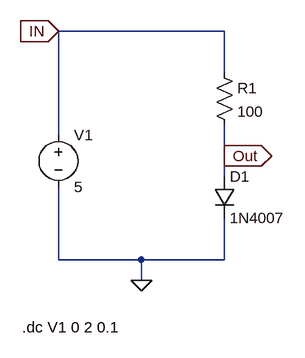
[diagram p0: schematic part1-1.1.asc]
part1-1.1.asc, the LTspice schematic file:
Version 4.1
SHEET 1 880 680
WIRE 96 -192 -160 -192
WIRE 96 -128 96 -192
WIRE -160 -32 -160 -192
WIRE 96 0 96 -48
WIRE 96 32 96 0
WIRE -160 160 -160 48
WIRE -32 160 -160 160
WIRE 96 160 96 96
WIRE 96 160 -32 160
WIRE -32 192 -32 160
FLAG -32 192 0
FLAG -160 -192 IN
IOPIN -160 -192 In
FLAG 96 0 Out
IOPIN 96 0 Out
SYMBOL diode 80 32 R0
SYMATTR InstName D1
SYMATTR Value 1N4007
SYMBOL voltage -160 -48 R0
WINDOW 123 0 0 Left 0
WINDOW 39 0 0 Left 0
SYMATTR InstName V1
SYMATTR Value 5
SYMBOL res 80 -144 R0
SYMATTR InstName R1
SYMATTR Value 100
TEXT -216 264 Left 2 !.dc V1 0 2 0.1

The netlist it stands for:
* part1-1.1.asc
D1 Out 0 1N4007
V1 IN 0 5
R1 IN Out 100
.model D D
.lib standard.dio
.dc V1 0 2 0.1
.backanno
.end

* Results of the author's LTspice run, read from the files saved beside the schematic
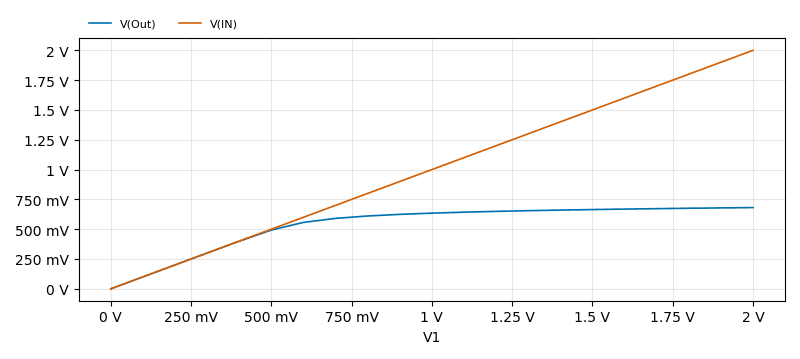
[diagram p1: DC transfer characteristic of part1-1.1.asc, plotted from the saved traces]
* DC transfer characteristic, 1 run:
*   V(Out): 0 V at V1=0 V, 681.4 mV at V1=2 V, min 0 V, max 681.4 mV
*   V(IN): 0 V at V1=0 V, 2 V at V1=2 V, min 0 V, max 2 V